# Altium schematic sheet 10_POWER_INPUT.SchDoc
size 420 x 297 mm
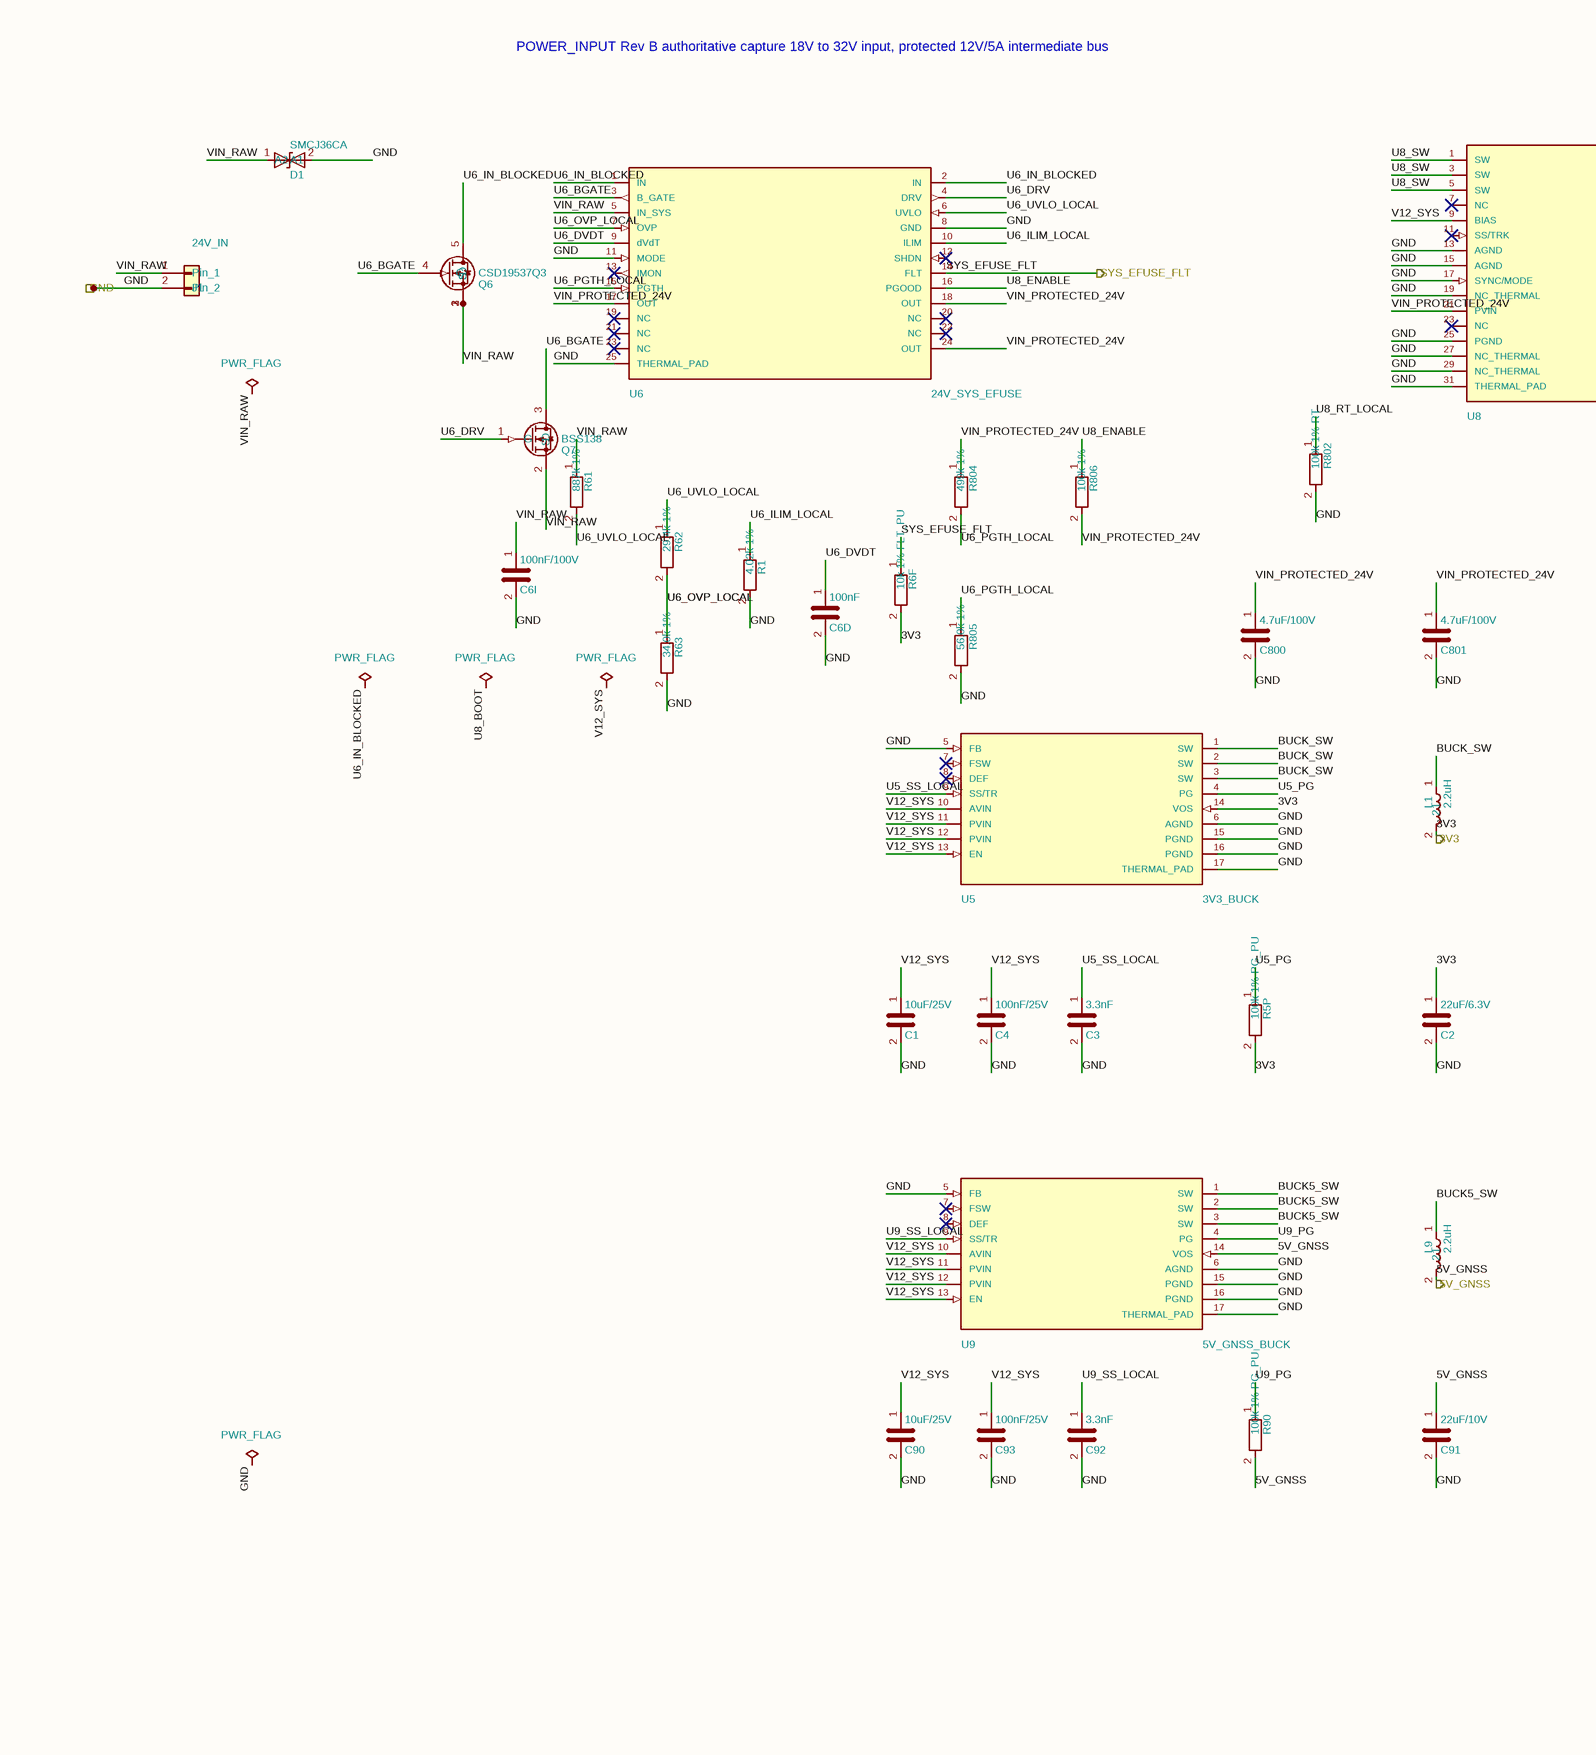
[diagram p0: 10_POWER_INPUT.SchDoc, left]
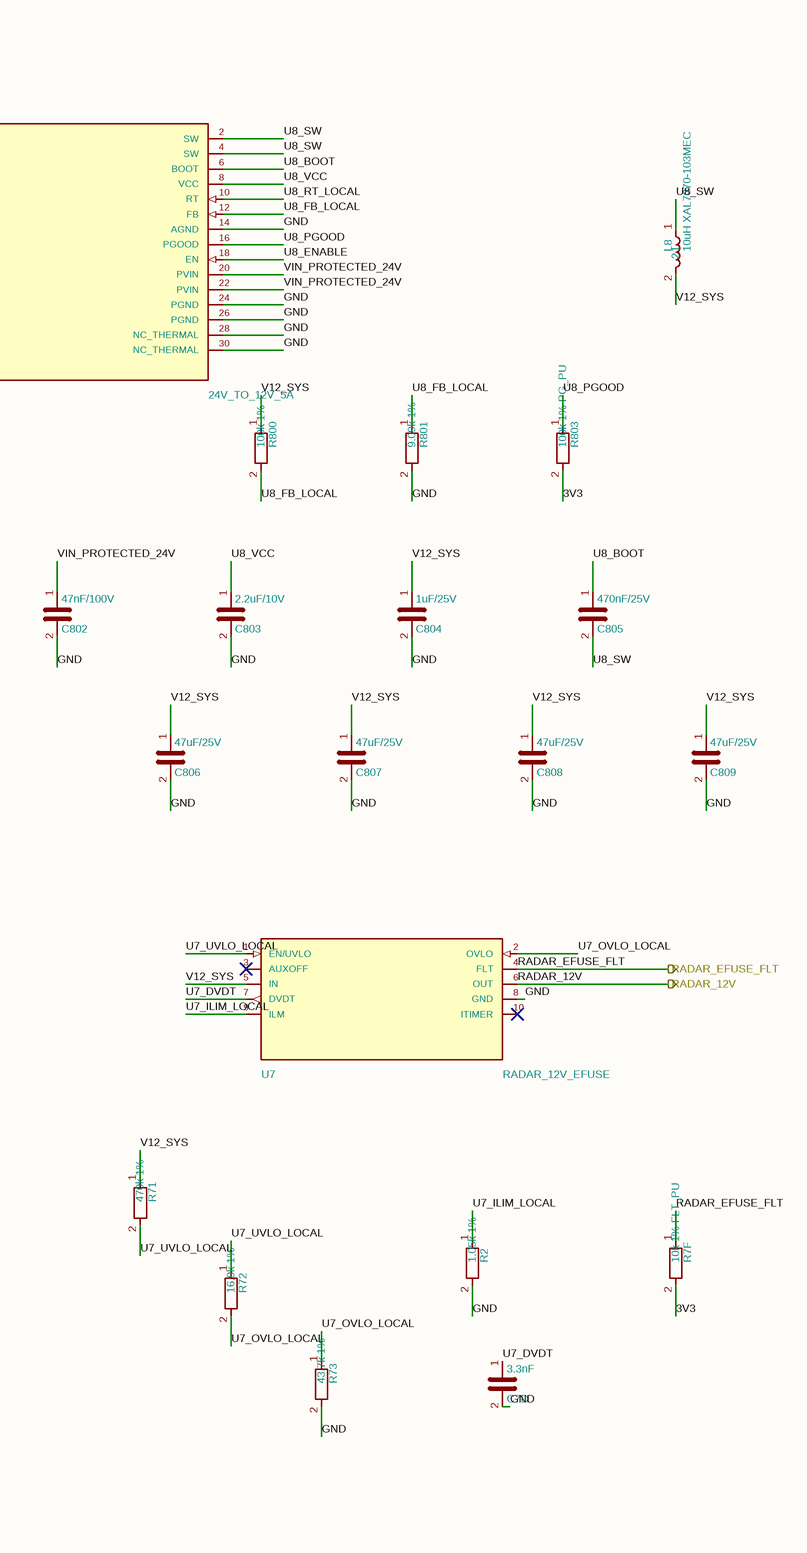
[diagram p1: 10_POWER_INPUT.SchDoc, right]

## Parts
#FLG0201  PWR_FLAG  (graphical)
#FLG0202  PWR_FLAG  (graphical)
#FLG0203  PWR_FLAG  (graphical)
#FLG0204  PWR_FLAG  (graphical)
#FLG0205  PWR_FLAG  (graphical)
C1  10uF/25V  [C_1206_3216Metric]
C2  22uF/6.3V  [C_1206_3216Metric]
C3  3.3nF  [C_0603_1608Metric]
C4  100nF/25V  [C_0603_1608Metric]
C6D  100nF  [C_0603_1608Metric]
C6I  100nF/100V  [C_0603_1608Metric]
C7D  3.3nF  [C_0603_1608Metric]
C90  10uF/25V  [C_1206_3216Metric]
C91  22uF/10V  [C_1206_3216Metric]
C92  3.3nF  [C_0603_1608Metric]
C93  100nF/25V  [C_0603_1608Metric]
C800  4.7uF/100V  [C_1210_3225Metric]
C801  4.7uF/100V  [C_1210_3225Metric]
C802  47nF/100V  [C_0603_1608Metric]
C803  2.2uF/10V  [C_0603_1608Metric]
C804  1uF/25V  [C_0603_1608Metric]
C805  470nF/25V  [C_0603_1608Metric]
C806  47uF/25V  [C_1210_3225Metric]
C807  47uF/25V  [C_1210_3225Metric]
C808  47uF/25V  [C_1210_3225Metric]
C809  47uF/25V  [C_1210_3225Metric]
D1  SMCJ36CA  [D_SMC]
J1  24V_IN  [Molex_43650-0200_RA_THT_2P]
L1  2.2uH  [Coilcraft_XFL4020_4x4]
L8  10uH XAL7070-103MEC  [L_Coilcraft_XAL7070-XXX]
L9  2.2uH  [Coilcraft_XFL4020_4x4]
Q6  CSD19537Q3  [VSON-8_3.3x3.3mm_P0.65mm_NexFET]
Q7  BSS138  [SOT-23]
R1  4.02k 1%  [R_0603_1608Metric]
R2  1.05k 1%  [R_0603_1608Metric]
R5P  100k 1% PG_PU  [R_0603_1608Metric]
R6F  10k 1% FLT_PU  [R_0603_1608Metric]
R7F  10k 1% FLT_PU  [R_0603_1608Metric]
R61  887k 1%  [R_0603_1608Metric]
R62  29.4k 1%  [R_0603_1608Metric]
R63  34.0k 1%  [R_0603_1608Metric]
R71  470k 1%  [R_0603_1608Metric]
R72  16.9k 1%  [R_0603_1608Metric]
R73  43.7k 1%  [R_0603_1608Metric]
R90  100k 1% PG_PU  [R_0603_1608Metric]
R800  100k 1%  [R_0603_1608Metric]
R801  9.09k 1%  [R_0603_1608Metric]
R802  100k 1% RT  [R_0603_1608Metric]
R803  100k 1% PG_PU  [R_0603_1608Metric]
R804  499k 1%  [R_0603_1608Metric]
R805  56.0k 1%  [R_0603_1608Metric]
R806  100k 1%  [R_0603_1608Metric]
U5  3V3_BUCK  [VQFN-16-1EP_3x3mm_P0.5mm_EP1.68x1.68mm]
U6  24V_SYS_EFUSE  [Texas_RGE0024C_VQFN-24-1EP_4x4mm_P0.5mm_EP2.1x2.1mm]
U7  RADAR_12V_EFUSE  [TPS259470A_RPW0010A_VQFN-HR-10_2x2mm_P0.475mm]
U8  24V_TO_12V_5A  [Texas_RNP0030B_WQFN-30-1EP_4x6mm_P0.5mm_EP1.8x4.5mm_ThermalVias]
U9  5V_GNSS_BUCK  [VQFN-16-1EP_3x3mm_P0.5mm_EP1.68x1.68mm]

## Ports
3V3 (out), 5V_GNSS (out), GND, RADAR_12V (out), RADAR_EFUSE_FLT (out), SYS_EFUSE_FLT (out)

## Nets
3V3: C2.1 L1.2 R5P.2 R6F.2 R7F.2 R803.2 U5.14(VOS) ; port 3V3
5V_GNSS: C91.1 L9.2 R90.2 U9.14(VOS) ; port 5V_GNSS
BUCK5_SW: L9.1 U9.1(SW) U9.2(SW) U9.3(SW)
BUCK_SW: L1.1 U5.1(SW) U5.2(SW) U5.3(SW)
GND: #FLG0202.1 C1.2 C2.2 C3.2 C4.2 C6D.2 C6I.2 C7D.2 C90.2 C91.2 C92.2 C93.2 C800.2 C801.2 C802.2 C803.2 C804.2 C806.2 C807.2 C808.2 C809.2 D1.2(A2) J1.2(Pin_2) R1.2 R2.2 R63.2 R73.2 R801.2 R802.2 R805.2 U5.5(FB) U5.6(AGND) U5.15(PGND) U5.16(PGND) U5.17(THERMAL_PAD) U6.8(GND) U6.11(MODE) U6.25(THERMAL_PAD) U7.8(GND) U8.13(AGND) U8.14(AGND) U8.15(AGND) U8.17(SYNC/MODE) U8.19(NC_THERMAL) U8.24(PGND) U8.25(PGND) U8.26(PGND) U8.27(NC_THERMAL) U8.28(NC_THERMAL) U8.29(NC_THERMAL) U8.30(NC_THERMAL) U8.31(THERMAL_PAD) U9.5(FB) U9.6(AGND) U9.15(PGND) U9.16(PGND) U9.17(THERMAL_PAD) ; port GND
RADAR_12V: U7.6(OUT) ; port RADAR_12V
RADAR_EFUSE_FLT: R7F.1 U7.4(FLT) ; port RADAR_EFUSE_FLT
SYS_EFUSE_FLT: R6F.1 U6.14(FLT) ; port SYS_EFUSE_FLT
U5_PG: R5P.1 U5.4(PG)
U5_SS_LOCAL: C3.1 U5.9(SS/TR)
U6_BGATE: Q6.4(G) Q7.3(D) U6.3(B_GATE)
U6_DRV: Q7.1(G) U6.4(DRV)
U6_DVDT: C6D.1 U6.9(dVdT)
U6_ILIM_LOCAL: R1.1 U6.10(ILIM)
U6_IN_BLOCKED: #FLG0203.1 Q6.5(D) U6.1(IN) U6.2(IN)
U6_OVP_LOCAL: R62.2 R63.1 U6.7(OVP)
U6_PGTH_LOCAL: R804.2 R805.1 U6.15(PGTH)
U6_UVLO_LOCAL: R61.2 R62.1 U6.6(UVLO)
U7_DVDT: C7D.1 U7.7(DVDT)
U7_ILIM_LOCAL: R2.1 U7.9(ILM)
U7_OVLO_LOCAL: R72.2 R73.1 U7.2(OVLO)
U7_UVLO_LOCAL: R71.2 R72.1 U7.1(EN/UVLO)
U8_BOOT: #FLG0204.1 C805.1 U8.6(BOOT)
U8_ENABLE: R806.1 U6.16(PGOOD) U8.18(EN)
U8_FB_LOCAL: R800.2 R801.1 U8.12(FB)
U8_PGOOD: R803.1 U8.16(PGOOD)
U8_RT_LOCAL: R802.1 U8.10(RT)
U8_SW: C805.2 L8.1 U8.1(SW) U8.2(SW) U8.3(SW) U8.4(SW) U8.5(SW)
U8_VCC: C803.1 U8.8(VCC)
U9_PG: R90.1 U9.4(PG)
U9_SS_LOCAL: C92.1 U9.9(SS/TR)
V12_SYS: #FLG0205.1 C1.1 C4.1 C90.1 C93.1 C804.1 C806.1 C807.1 C808.1 C809.1 L8.2 R71.1 R800.1 U5.10(AVIN) U5.11(PVIN) U5.12(PVIN) U5.13(EN) U7.5(IN) U8.9(BIAS) U9.10(AVIN) U9.11(PVIN) U9.12(PVIN) U9.13(EN)
VIN_PROTECTED_24V: C800.1 C801.1 C802.1 R804.1 R806.2 U6.17(OUT) U6.18(OUT) U6.24(OUT) U8.20(PVIN) U8.21(PVIN) U8.22(PVIN)
VIN_RAW: #FLG0201.1 C6I.1 D1.1(A1) J1.1(Pin_1) Q6.1(S) Q6.2(S) Q6.3(S) Q7.2(S) R61.1 U6.5(IN_SYS)

Not connected (* = marked no-connect by the designer): U5 7(FSW)* 8(DEF)*; U6 12(SHDN)* 13(IMON)* 19(NC)* 20(NC)* 21(NC)* 22(NC)* 23(NC)*; U7 3(AUXOFF)* 10(ITIMER)*; U8 7(NC)* 11(SS/TRK)* 23(NC)*; U9 7(FSW)* 8(DEF)*

## Notes on the sheet
- POWER_INPUT Rev B authoritative capture
  18V to 32V input, protected 12V/5A intermediate bus
- 1
- 2
- 3
- 4
- 5
- 6
- 7
- 8
- A
- B
- C
- D
- E
- Title: EVT_SYS_CARRIER
- File: 10_POWER_INPUT.kicad_sch
- Sheet: /
- F
- KiCad E.D.A.  kicad (5.1.4)-1
- Size: A3
- Date:
- Rev:
- Id: 1/1

## Library data of the parts
#FLG0201 #FLG0202 #FLG0203 #FLG0204 #FLG0205 = PWR_FLAG: hierarchy_path: /66980d89-56fb-4772-93a7-06a61d388399/6dd53468-99c2-4197-8bec-3687fb851dcd; Value: PWR_FLAG
C1 C90 = C: MPN: 10uF_25V_X7R; hierarchy_path: /66980d89-56fb-4772-93a7-06a61d388399/6dd53468-99c2-4197-8bec-3687fb851dcd; Value: 10uF/25V; Footprint: Capacitor_SMD:C_1206_3216Metric
C2 = C: MPN: 22uF_6.3V_X7R; hierarchy_path: /66980d89-56fb-4772-93a7-06a61d388399/6dd53468-99c2-4197-8bec-3687fb851dcd; Value: 22uF/6.3V; Footprint: Capacitor_SMD:C_1206_3216Metric
C3 C7D C92 = C: MPN: 3.3nF_X7R; hierarchy_path: /66980d89-56fb-4772-93a7-06a61d388399/6dd53468-99c2-4197-8bec-3687fb851dcd; Value: 3.3nF; Footprint: Capacitor_SMD:C_0603_1608Metric
C4 C6D C93 = C: MPN: 100nF_25V_X7R; hierarchy_path: /66980d89-56fb-4772-93a7-06a61d388399/6dd53468-99c2-4197-8bec-3687fb851dcd; Footprint: Capacitor_SMD:C_0603_1608Metric
  C4 C93: Value: 100nF/25V
  C6D: Value: 100nF
C6I = C: MPN: 100nF_100V_X7R; hierarchy_path: /66980d89-56fb-4772-93a7-06a61d388399/6dd53468-99c2-4197-8bec-3687fb851dcd; Value: 100nF/100V; Footprint: Capacitor_SMD:C_0603_1608Metric
C91 = C: MPN: 22uF_10V_X7R; hierarchy_path: /66980d89-56fb-4772-93a7-06a61d388399/6dd53468-99c2-4197-8bec-3687fb851dcd; Value: 22uF/10V; Footprint: Capacitor_SMD:C_1206_3216Metric
C800 C801 = C: MPN: C3225X7S2A475K200AB; hierarchy_path: /66980d89-56fb-4772-93a7-06a61d388399/6dd53468-99c2-4197-8bec-3687fb851dcd; Value: 4.7uF/100V; Footprint: Capacitor_SMD:C_1210_3225Metric
C802 = C: MPN: 47nF_100V_X7R; hierarchy_path: /66980d89-56fb-4772-93a7-06a61d388399/6dd53468-99c2-4197-8bec-3687fb851dcd; Value: 47nF/100V; Footprint: Capacitor_SMD:C_0603_1608Metric
C803 = C: MPN: 2.2uF_10V_X7R; hierarchy_path: /66980d89-56fb-4772-93a7-06a61d388399/6dd53468-99c2-4197-8bec-3687fb851dcd; Value: 2.2uF/10V; Footprint: Capacitor_SMD:C_0603_1608Metric
C804 = C: MPN: 1uF_25V_X7R; hierarchy_path: /66980d89-56fb-4772-93a7-06a61d388399/6dd53468-99c2-4197-8bec-3687fb851dcd; Value: 1uF/25V; Footprint: Capacitor_SMD:C_0603_1608Metric
C805 = C: MPN: 470nF_25V_X7R; hierarchy_path: /66980d89-56fb-4772-93a7-06a61d388399/6dd53468-99c2-4197-8bec-3687fb851dcd; Value: 470nF/25V; Footprint: Capacitor_SMD:C_0603_1608Metric
C806-C809 = C: MPN: 47uF_25V_X7R; hierarchy_path: /66980d89-56fb-4772-93a7-06a61d388399/6dd53468-99c2-4197-8bec-3687fb851dcd; Value: 47uF/25V; Footprint: Capacitor_SMD:C_1210_3225Metric
D1 = D_TVS: hierarchy_path: /66980d89-56fb-4772-93a7-06a61d388399/6dd53468-99c2-4197-8bec-3687fb851dcd; MPN: SMCJ36CA; Value: SMCJ36CA; Footprint: Diode_SMD:D_SMC
J1 = Conn_01x02: MPN: 43650-0200; hierarchy_path: /66980d89-56fb-4772-93a7-06a61d388399/6dd53468-99c2-4197-8bec-3687fb851dcd; Value: 24V_IN; Footprint: SystemCarrier_Altium:Molex_43650-0200_RA_THT_2P
L1 L9 = L: MPN: XFL4020-222MEC; hierarchy_path: /66980d89-56fb-4772-93a7-06a61d388399/6dd53468-99c2-4197-8bec-3687fb851dcd; Value: 2.2uH; Footprint: SystemCarrier_Altium:Coilcraft_XFL4020_4x4
L8 = L: hierarchy_path: /66980d89-56fb-4772-93a7-06a61d388399/6dd53468-99c2-4197-8bec-3687fb851dcd; MPN: XAL7070-103MEC; Value: 10uH XAL7070-103MEC; Footprint: Inductor_SMD:L_Coilcraft_XAL7070-XXX
Q6 = CSD19537Q3: hierarchy_path: /66980d89-56fb-4772-93a7-06a61d388399/6dd53468-99c2-4197-8bec-3687fb851dcd; MPN: CSD19537Q3; Value: CSD19537Q3; Footprint: Package_SON:VSON-8_3.3x3.3mm_P0.65mm_NexFET
Q7 = BSS138: hierarchy_path: /66980d89-56fb-4772-93a7-06a61d388399/6dd53468-99c2-4197-8bec-3687fb851dcd; MPN: BSS138; Value: BSS138; Footprint: Package_TO_SOT_SMD:SOT-23
R1 = R: MPN: 4.02k_1%; hierarchy_path: /66980d89-56fb-4772-93a7-06a61d388399/6dd53468-99c2-4197-8bec-3687fb851dcd; Value: 4.02k 1%; Footprint: Resistor_SMD:R_0603_1608Metric
R2 = R: MPN: 1.05k_1%; hierarchy_path: /66980d89-56fb-4772-93a7-06a61d388399/6dd53468-99c2-4197-8bec-3687fb851dcd; Value: 1.05k 1%; Footprint: Resistor_SMD:R_0603_1608Metric
R5P R90 R800 R802 R803 R806 = R: MPN: 100k_1%; hierarchy_path: /66980d89-56fb-4772-93a7-06a61d388399/6dd53468-99c2-4197-8bec-3687fb851dcd; Footprint: Resistor_SMD:R_0603_1608Metric
  R5P R90 R803: Value: 100k 1% PG_PU
  R800 R806: Value: 100k 1%
  R802: Value: 100k 1% RT
R6F R7F = R: MPN: 10k_1%; hierarchy_path: /66980d89-56fb-4772-93a7-06a61d388399/6dd53468-99c2-4197-8bec-3687fb851dcd; Value: 10k 1% FLT_PU; Footprint: Resistor_SMD:R_0603_1608Metric
R61 = R: MPN: 887k_1%; hierarchy_path: /66980d89-56fb-4772-93a7-06a61d388399/6dd53468-99c2-4197-8bec-3687fb851dcd; Value: 887k 1%; Footprint: Resistor_SMD:R_0603_1608Metric
R62 = R: MPN: 29.4k_1%; hierarchy_path: /66980d89-56fb-4772-93a7-06a61d388399/6dd53468-99c2-4197-8bec-3687fb851dcd; Value: 29.4k 1%; Footprint: Resistor_SMD:R_0603_1608Metric
R63 = R: MPN: 34.0k_1%; hierarchy_path: /66980d89-56fb-4772-93a7-06a61d388399/6dd53468-99c2-4197-8bec-3687fb851dcd; Value: 34.0k 1%; Footprint: Resistor_SMD:R_0603_1608Metric
R71 = R: MPN: 470k_1%; hierarchy_path: /66980d89-56fb-4772-93a7-06a61d388399/6dd53468-99c2-4197-8bec-3687fb851dcd; Value: 470k 1%; Footprint: Resistor_SMD:R_0603_1608Metric
R72 = R: MPN: 16.9k_1%; hierarchy_path: /66980d89-56fb-4772-93a7-06a61d388399/6dd53468-99c2-4197-8bec-3687fb851dcd; Value: 16.9k 1%; Footprint: Resistor_SMD:R_0603_1608Metric
R73 = R: MPN: 43.7k_1%; hierarchy_path: /66980d89-56fb-4772-93a7-06a61d388399/6dd53468-99c2-4197-8bec-3687fb851dcd; Value: 43.7k 1%; Footprint: Resistor_SMD:R_0603_1608Metric
R801 = R: MPN: 9.09k_1%; hierarchy_path: /66980d89-56fb-4772-93a7-06a61d388399/6dd53468-99c2-4197-8bec-3687fb851dcd; Value: 9.09k 1%; Footprint: Resistor_SMD:R_0603_1608Metric
R804 = R: MPN: 499k_1%; hierarchy_path: /66980d89-56fb-4772-93a7-06a61d388399/6dd53468-99c2-4197-8bec-3687fb851dcd; Value: 499k 1%; Footprint: Resistor_SMD:R_0603_1608Metric
R805 = R: MPN: 56.0k_1%; hierarchy_path: /66980d89-56fb-4772-93a7-06a61d388399/6dd53468-99c2-4197-8bec-3687fb851dcd; Value: 56.0k 1%; Footprint: Resistor_SMD:R_0603_1608Metric
U5 = TPS62132RGTR: Capture_Status: LOCAL_CONTRACT_SYMBOL; hierarchy_path: /66980d89-56fb-4772-93a7-06a61d388399/6dd53468-99c2-4197-8bec-3687fb851dcd; MPN: TPS62132RGTR; Value: 3V3_BUCK; Footprint: Package_DFN_QFN:VQFN-16-1EP_3x3mm_P0.5mm_EP1.68x1.68mm
U6 = TPS26630RGER: Capture_Status: LOCAL_CONTRACT_SYMBOL; hierarchy_path: /66980d89-56fb-4772-93a7-06a61d388399/6dd53468-99c2-4197-8bec-3687fb851dcd; MPN: TPS26630RGER; Value: 24V_SYS_EFUSE; Footprint: Package_DFN_QFN:Texas_RGE0024C_VQFN-24-1EP_4x4mm_P0.5mm_EP2.1x2.1mm
U7 = TPS259470ARPWR: Capture_Status: LOCAL_CONTRACT_SYMBOL; hierarchy_path: /66980d89-56fb-4772-93a7-06a61d388399/6dd53468-99c2-4197-8bec-3687fb851dcd; MPN: TPS259470ARPWR; Value: RADAR_12V_EFUSE; Footprint: SystemCarrier_Local:TPS259470A_RPW0010A_VQFN-HR-10_2x2mm_P0.475mm
U8 = LM76005RNPR: Capture_Status: LOCAL_CONTRACT_SYMBOL; hierarchy_path: /66980d89-56fb-4772-93a7-06a61d388399/6dd53468-99c2-4197-8bec-3687fb851dcd; MPN: LM76005RNPR; Value: 24V_TO_12V_5A; Footprint: Package_DFN_QFN:Texas_RNP0030B_WQFN-30-1EP_4x6mm_P0.5mm_EP1.8x4.5mm_ThermalVias
U9 = TPS62133RGTR: Capture_Status: LOCAL_CONTRACT_SYMBOL; hierarchy_path: /66980d89-56fb-4772-93a7-06a61d388399/6dd53468-99c2-4197-8bec-3687fb851dcd; MPN: TPS62133RGTR; Value: 5V_GNSS_BUCK; Footprint: Package_DFN_QFN:VQFN-16-1EP_3x3mm_P0.5mm_EP1.68x1.68mm